# Altium project Smart-Switch-v1.0.PrjPcb (part 1 of 2)
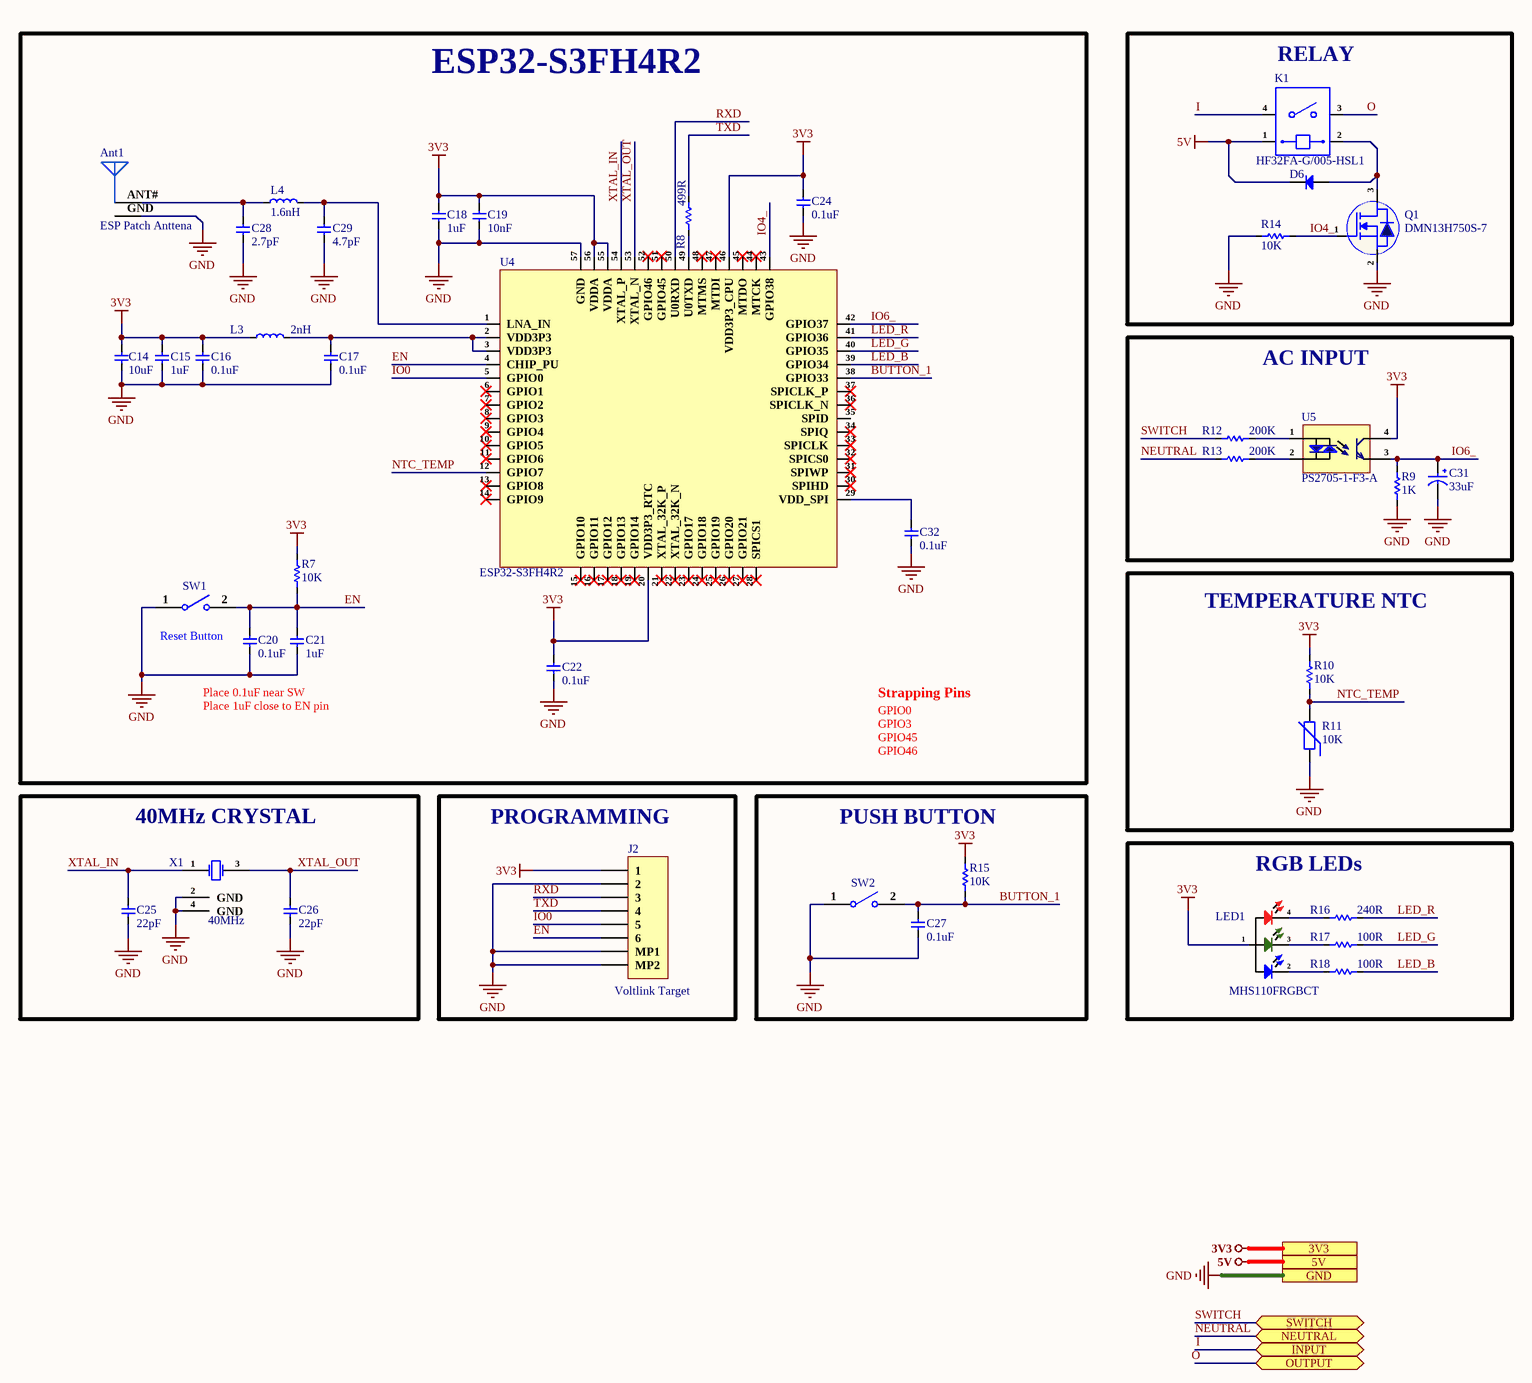
[diagram p0: Controller-Sheet.SchDoc]
3 sheets, 74 parts. Net scope: hierarchical (ports join the sheet entries above them; power ports are global).
Board file: Smart-Switch-v1.0.PcbDoc
Sheets:
  Controller-Sheet.SchDoc
  Top-Sheet.SchDoc
    U_Power-Sheet = Power-Sheet.SchDoc

## Sheet Controller-Sheet.SchDoc: Title
size 420 x 297 mm; Date: *******; ApprovedBy: *******; CheckedBy: None; Author: *******; CompanyName: *******; DrawnBy: Name; Engineer: *******; Organization: *******; Address1: *******; Address2: *******; Address3: *******; Address4: *******; DocumentNumber: Doc Num; Revision: *******; SheetNumber: 3; SheetTotal: 3; CurrentTime: *******; CurrentDate: *******; Time: *******; DocumentFullPathAndName: *******; DocumentName: *******; ModifiedDate: *******; ImagePath: *******; ProjectName: *******; Application_BuildNumber: *******

### Parts
Ant1  ESP Patch Anttena  [ESP Patch Antenna]  (net tie, no BOM)
C14  10uF  [Cap-0402]
C15  1uF  [CAP-0201]
C16  0.1uF  [CAP-0201]
C17  0.1uF  [CAP-0201]
C18  1uF  [CAP-0201]
C19  10nF  [CAP-0201]
C20  0.1uF  [CAP-0201]
C21  1uF  [CAP-0201]
C22  0.1uF  [CAP-0201]
C24  0.1uF  [CAP-0201]
C25  22pF  [CAP-0201]
C26  22pF  [CAP-0201]
C27  0.1uF  [CAP-0201]
C28  2.7pF  [CAP-0201]
C29  4.7pF  [CAP-0201]
C31  33uF  [Case-B]
C32  0.1uF  [CAP-0201]
D6  1N4148WT  [SOD-523F]  (value not drawn)
J2  Voltlink Target  [Voltlink Target]
K1  HF32FA-G/005-HSL1  [HF32FA-G/005-HSL1]
L3  2nH  [IND-0603 (1608 Metric)]
L4  1.6nH  [IND-0603 (1608 Metric)]
LED1  MHS110FRGBCT  [MHS110FRGBCT]
Q1  DMN13H750S-7  [SOT-23]
R7  10K  [Res-0201]
R8  499R  [Res-0201]
R9  1K  [Res-0402]
R10  10K  [Res-0201]
R11  10K  [Res-0603]
R12  200K  [Res_1210]
R13  200K  [Res_1210]
R14  10K  [Res-0201]
R15  10K  [Res-0201]
R16  240R  [Res-0603]
R17  100R  [RES-0603]
R18  100R  [RES-0603]
SW1  B3U-1000P  [B3U-1000P]  (value not drawn)
SW2  B3U-1000P  [B3U-1000P]  (value not drawn)
U4  ESP32-S3FH4R2  [QFNWB-56 (7×7)]
U5  PS2705-1-F3-A  [SOP-4_2.54]
X1  40MHz  [X322540MPB4SI_]

### Blocks framed on the sheet
ESP32-S3FH4R2: Ant1 C14-C22 C24 C28 C29 C32 L3 L4 R7 R8 SW1 U4
RELAY: D6 K1 Q1 R14
AC INPUT: C31 R9 R12 R13 U5
TEMPERATURE NTC: R10 R11
40MHz CRYSTAL: C25 C26 X1
PROGRAMMING: J2
PUSH BUTTON: C27 R15 SW2
RGB LEDs: LED1 R16-R18

### Ports
3V3 (see Top-Sheet[3B], Power-Sheet[3D]), 5V (see Top-Sheet[3C], Power-Sheet[3D]), GND (see Top-Sheet[3B], Power-Sheet[3D]), INPUT (bidir, see Top-Sheet[3B], Power-Sheet[2D]), NEUTRAL (bidir, see Top-Sheet[3C], Power-Sheet[2D]), OUTPUT (bidir, see Top-Sheet[3B], Power-Sheet[2D]), SWITCH (bidir, see Top-Sheet[3C], Power-Sheet[2D])

### Nets
3V3: C14.2 C15.2 C16.2 C18.2 C19.2 C22.2 C24.2 J2.1 L3.1 LED1.1(+) R7.2 R10.1 R15.2 U4.20(VDD3P3_RTC) U4.46(VDD3P3_CPU) U4.55(VDDA) U4.56(VDDA) U5.4(C) ; port 3V3
5V: D6.2(K) K1.1 ; port 5V
GND: Ant1.GND C14.1 C15.1 C16.1 C17.1 C18.1 C19.1 C20.1 C21.1 C22.1 C24.1 C25.1 C26.1 C27.1 C28.1 C29.1 C31.2 C32.1 J2.2 J2.MP1 J2.MP2 Q1.2(S) R9.1 R11.1 R14.2 SW1.1 SW2.1 U4.57(GND) X1.2(GND) X1.4(GND) ; port GND
BUTTON_1: C27.2 R15.1 SW2.2 U4.38(GPIO33)
EN: C20.2 C21.2 J2.6 R7.1 SW1.2 U4.4(CHIP_PU)
I: K1.4 ; port INPUT
IO0: J2.5 U4.5(GPIO0)
IO4_: Q1.1(G) R14.1 U4.43(GPIO38)
IO6_: C31.1 R9.2 U4.42(GPIO37) U5.3(E)
LED_B: R18.2 U4.39(GPIO34)
LED_G: R17.2 U4.40(GPIO35)
LED_R: R16.2 U4.41(GPIO36)
NEUTRAL: R13.1 ; port NEUTRAL
NTC_TEMP: R10.2 R11.2 U4.12(GPIO7)
O: K1.3 ; port OUTPUT
RXD: J2.3 U4.50(U0RXD)
SWITCH: R12.1 ; port SWITCH
TXD: J2.4 R8.2
XTAL_IN: C25.2 U4.54(XTAL_P) X1.1(CRYSTAL)
XTAL_OUT: C26.2 U4.53(XTAL_N) X1.3(CRYSTAL)
NetAnt1_ANT#: Ant1.ANT# C28.2 L4.1
NetC17_2: C17.2 L3.2 U4.2(VDD3P3) U4.3(VDD3P3)
NetC29_2: C29.2 L4.2 U4.1(LNA_IN)
NetC32_2: C32.2 U4.29(VDD_SPI)
NetD6_1: D6.1(A) K1.2 Q1.3(D)
NetLED1_2: LED1.2(-BLUE) R18.1
NetLED1_3: LED1.3(-GREEN) R17.1
NetLED1_4: LED1.4(-RED) R16.1
NetR8_1: R8.1 U4.49(U0TXD)
NetR12_2: R12.2 U5.1(An)
NetR13_2: R13.2 U5.2(Ca)

Not connected (* = marked no-connect by the designer): U4 6(GPIO1)* 7(GPIO2)* 8(GPIO3)* 9(GPIO4)* 10(GPIO5)* 11(GPIO6)* 13(GPIO8)* 14(GPIO9)* 15(GPIO10)* 16(GPIO11)* 17(GPIO12)* 18(GPIO13)* 19(GPIO14)* 21(XTAL_32K_P)* 22(XTAL_32K_N)* 23(GPIO17)* 24(GPIO18)* 25(GPIO19)* 26(GPIO20)* 27(GPIO21)* 28(SPICS1)* 30(SPIHD)* 31(SPIWP)* 32(SPICS0)* 33(SPICLK)* 34(SPIQ)* 35(SPID) 36(SPICLK_N)* 37(SPICLK_P)* 44(MTCK)* 45(MTDO)* 47(MTDI)* 48(MTMS)* 51(GPIO45)* 52(GPIO46)*

### Notes on the sheet
- Reset Button
- Place 1uF close to EN pin
- Place 0.1uF near SW
- Strapping Pins
- GPIO0
  GPIO3
  GPIO45
  GPIO46
- File:
- Title:
- Date:
- Page
- Num:
- Total:
- Drawn By: Huzaifa Ali

### Library data of the parts
Ant1 = ESP Patch Anttena: ESP32 MIFA PCB ANTENNA; Item Type: Antenna; Manufacturer Part Number: ESP Patch Anttena
C14 = CL05A106MP5NUNC: CAP CER 10UF 10V X5R 0402; Manufacturer: Samsung; Tolerance: 20%; Item Type: Capacitor; Supplier 1: Avnet; Manufacturer Part Number: CL05A106MP5NUNC; RoHS: Yes; Category: Ceramic Capacitors; Stock 1: 1729850; Pricing 1: 10000=0.02537 (USD); Mount: Surface Mount; Case/Package: 0402; Case Code (Metric): 1005; Case Code (Imperial): 0402; Contact Plating: Tin; Min Operating Temperature: -55°C; Max Operating Temperature: 85°C; Package Quantity: 1; Packaging: Tape and Reel; Capacitance: 10uF; Voltage Rating: 10V; Dielectric: X5R; Termination: Wraparound; Series: CL; Construction: Flat; Length: 1mm; Width: 0.02inch; Thickness: 0.028inch; Depth: 0.5mm; Radiation Hardening: No; Lead Free: Lead Free; RoHS Compliant: Yes; ComponentLink1URL: https://datasheet.ciiva.com/25721/cl05a106mp5nunc-25721584.pdf?src-supplier=Digi-Key; ComponentLink1Description: https://datasheet.ciiva.com/25721/cl05a106mp5nunc-25721584.pdf?src-supplier=Digi-Key; ComponentLink2URL: https://datasheet.ciiva.com/26838/getdatasheetpartid-745310-26838170.pdf?src-supplier=Verical; ComponentLink2Description: https://datasheet.ciiva.com/26838/getdatasheetpartid-745310-26838170.pdf?src-supplier=Verical; Supplier Part Number 1: CL05A106MP5NUNC; LCSC Part Number: C315248
C15 C18 C21 = GRM033R61C105ME15D: CAP CER 1UF 16V X5R 0201; Manufacturer: Murata; Item Type: Capacitor; Supplier 1: Digi-Key; Manufacturer Part Number: GRM033R61C105ME15D; Stock 1: 12823; Pricing 1: 1=0.14, 10=0.098, 50=0.0554, 100=0.0459, 500=0.0322, 1000=0.02665, 2500=0.02481, 5000=0.0227 (USD); ComponentLink1URL: https://datasheet.octopart.com/GRM033R61C105ME15D-Murata-datasheet-155345049.pdf?src-supplier=Element14; ComponentLink1Description: https://datasheet.octopart.com/GRM033R61C105ME15D-Murata-datasheet-155345049.pdf?src-supplier=Element14; Supplier Part Number 1: 490-18654-1-ND; LCSC Part Number: C335102; RoHS: No; Category: Ceramic Capacitors; ComponentLink2URL: https://datasheet.octopart.com/GRM033R61C105ME15D-Murata-datasheet-165579666.pdf?src-supplier=TME; ComponentLink2Description: https://datasheet.octopart.com/GRM033R61C105ME15D-Murata-datasheet-165579666.pdf?src-supplier=TME
C16 C17 C20 C22 C24 C27 C32 = GRM033R61E104KE14D: CAP CER 0.1UF 25V X5R 0201; Manufacturer: Murata; Tolerance: 10%; Item Type: Capacitor; Material: 4241ConductorMaterial; Value: 100nF; Manufacturer Part Number: GRM033R61E104KE14D; RoHS: Yes; Category: Ceramic Capacitors; Case/Package: 0201; Case Code (Metric): 0603; Case Code (Imperial): 0201; Weight: 1.2E-05oz; Min Operating Temperature: -55°C; Max Operating Temperature: 85°C; Packaging: Tape and Reel; Voltage Rating: 25V; Dielectric: X5R; Termination: SMD/SMT; Voltage Rating (DC): 25V; Package Quantity: 15000; Series: GRM; Length: 0.024inch; Width: 0.012inch; Height: 0.3mm; Thickness: 0.013inch; Lead Free: Lead Free; RoHS Compliant: Yes; ComponentLink1URL: http://www.farnell.com/datasheets/2867843.pdf?src-supplier=Farnell; ComponentLink1Description: http://www.farnell.com/datasheets/2867843.pdf?src-supplier=Farnell; ComponentLink2URL: http://www.mouser.com/ds/2/281/c02e-2905.pdf?src-supplier=Mouser; ComponentLink2Description: http://www.mouser.com/ds/2/281/c02e-2905.pdf?src-supplier=Mouser; ComponentLink3URL: https://datasheet.octopart.com/GRM033R61E104KE14D-Murata-datasheet-22122223.pdf?src-supplier=Future+Electronics; ComponentLink3Description: https://datasheet.octopart.com/GRM033R61E104KE14D-Murata-datasheet-22122223.pdf?src-supplier=Future+Electronics; ComponentLink4URL: http://www.farnell.com/datasheets/2867843.pdf?src-supplier=Element14; ComponentLink4Description: http://www.farnell.com/datasheets/2867843.pdf?src-supplier=Element14; ComponentLink5URL: http://search.murata.co.jp/Ceramy/image/img/A01X/G101/ENG/GRM033R61E104KE14-01.pdf?src-supplier=Digi-Key; ComponentLink5Description: http://search.murata.co.jp/Ceramy/image/img/A01X/G101/ENG/GRM033R61E104KE14-01.pdf?src-supplier=Digi-Key; LCSC Part Number: C76939; Supplier: Rs; Supplier Part Number: 1852066; Stock: 14000; Pricing: 1000=0.008, 5000=0.007, 10000=0.006 (GBP); Mounting Technology: Surface Mount; ComponentLink6URL: http://www.farnell.com/datasheets/2867843.pdf?src-supplier=Newark; ComponentLink6Description: http://www.farnell.com/datasheets/2867843.pdf?src-supplier=Newark; ComponentLink7URL: https://datasheet.octopart.com/GRM033R61E104KE14D-Murata-datasheet-165579666.pdf?src-supplier=TME; ComponentLink7Description: https://datasheet.octopart.com/GRM033R61E104KE14D-Murata-datasheet-165579666.pdf?src-supplier=TME
C19 = GRM033R71E103KE14D: CAP CER 10000PF 25V X7R 0201; Manufacturer: Murata; Tolerance: 10%; Item Type: Capacitor; Material: 4241ConductorMaterial; Supplier 1: Avnet; Manufacturer Part Number: GRM033R71E103KE14D; RoHS: Yes; Category: Ceramic Capacitors; Stock 1: 60000; Pricing 1: 15000=0.00231 (USD); Mount: Surface Mount; Case/Package: 0201; Min Operating Temperature: -55°C; Max Operating Temperature: 125°C; Capacitance: 10nF; Dielectric: X7R; Voltage Rating: 25V; Voltage Rating (DC): 25V; Series: GRM; Length: 600um; Width: 300um; Height: 330um; Thickness: 300um; RoHS Compliant: Yes; ComponentLink1URL: http://www.farnell.com/datasheets/2867850.pdf?src-supplier=Farnell; ComponentLink1Description: http://www.farnell.com/datasheets/2867850.pdf?src-supplier=Farnell; ComponentLink2URL: http://www.farnell.com/datasheets/2867850.pdf?src-supplier=Element14; ComponentLink2Description: http://www.farnell.com/datasheets/2867850.pdf?src-supplier=Element14; ComponentLink3URL: http://search.murata.co.jp/Ceramy/image/img/A01X/G101/ENG/GRM033R71E103KE14-01.pdf?src-supplier=Digi-Key; ComponentLink3Description: http://search.murata.co.jp/Ceramy/image/img/A01X/G101/ENG/GRM033R71E103KE14-01.pdf?src-supplier=Digi-Key; ComponentLink4URL: https://datasheet.octopart.com/GRM033R71E103KE14D-Murata-datasheet-99353822.pdf?src-supplier=Future+Electronics; ComponentLink4Description: https://datasheet.octopart.com/GRM033R71E103KE14D-Murata-datasheet-99353822.pdf?src-supplier=Future+Electronics; ComponentLink5URL: http://www.farnell.com/datasheets/2867850.pdf?src-supplier=Newark; ComponentLink5Description: http://www.farnell.com/datasheets/2867850.pdf?src-supplier=Newark; ComponentLink6URL: https://datasheet.octopart.com/GRM033R71E103KE14D-Murata-datasheet-165579666.pdf?src-supplier=TME; ComponentLink6Description: https://datasheet.octopart.com/GRM033R71E103KE14D-Murata-datasheet-165579666.pdf?src-supplier=TME; Supplier Part Number 1: GRM033R71E103KE14D; LCSC Part Number: C85930
C25 C26 = GRM0335C1H220JA01D: CAP CER 22PF 50V C0G/NP0 0201; Manufacturer: Murata; Tolerance: 5%; Dielectric: C0G; Temperature Coefficient: 30ppm/°C; Item Type: Capacitor; Material: 4241ConductorMaterial; Manufacturer Part Number: GRM0335C1H220JA01D; RoHS: Yes; Category: Ceramic Capacitors; Mounting Technology: Surface Mount; Case/Package: 0201; Case Code (Metric): 0603; Case Code (Imperial): 0201; Min Operating Temperature: -55°C; Max Operating Temperature: 125°C; Value: 22pF; Voltage Rating: 50V; Packaging: Tape and Reel; Package Quantity: 1; Voltage Rating (DC): 50V; Termination: SMD/SMT; Voltage: 50V; Series: GRM; Length: 0.024inch; Width: 0.012inch; Height: 0.3mm; Depth: 0.3mm; Lead Free: Lead Free; RoHS Compliant: Yes; ComponentLink1URL: https://datasheet.ciiva.com/6271/partnumbering-e-01-6271146.pdf?src-supplier=Digi-Key; ComponentLink1Description: https://datasheet.ciiva.com/6271/partnumbering-e-01-6271146.pdf?src-supplier=Digi-Key; ComponentLink2URL: https://datasheet.ciiva.com/6271/partnumbering-e-01-6271143.pdf?src-supplier=Digi-Key; ComponentLink2Description: https://datasheet.ciiva.com/6271/partnumbering-e-01-6271143.pdf?src-supplier=Digi-Key; ComponentLink3URL: https://datasheet.ciiva.com/6271/partnumbering-e-01-6271149.pdf?src-supplier=Digi-Key; ComponentLink3Description: https://datasheet.ciiva.com/6271/partnumbering-e-01-6271149.pdf?src-supplier=Digi-Key; LCSC Part Number: C76924; Supplier: Rs; Supplier Part Number: 8202728; Stock: 9500; Pricing: 500=0.004, 5000=0.003, 12500=0.002, 50000=0.002 (GBP)
C28 = CC0201CRNPO9BN2R7: CAP CER 2.7PF 50V C0G/NPO 0201; Manufacturer: Yageo; Dielectric: C0G; Item Type: Capacitor; Supplier: Avnet; Supplier Part Number: CC0201CRNPO9BN2R7; Manufacturer Part Number: CC0201CRNPO9BN2R7; RoHS: Yes; Category: Ceramic Capacitors; Stock: 15000; Pricing: 15000=0.0017 (USD); Mounting Technology: Surface Mount; Case/Package: 0201; Case Code (Imperial): 0201; Case Code (Metric): 0603; Weight: 6E-06oz; Min Operating Temperature: -55°C; Max Operating Temperature: 125°C; Value: 2.7pF; Packaging: Tape and Reel; Voltage Rating (DC): 50V; Voltage Rating: 50V; Termination: SMD/SMT; Series: CC; Length: 0.024inch; Width: 0.012inch; Thickness: 0.013inch; RoHS Compliant: Yes; ComponentLink1URL: https://datasheet.ciiva.com/13208/upy-gp-np0-16v-to-50v-8-13208314.pdf?src-supplier=Mouser; ComponentLink1Description: https://datasheet.ciiva.com/13208/upy-gp-np0-16v-to-50v-8-13208314.pdf?src-supplier=Mouser; LCSC Part Number: C325439
C29 = CC0201BRNPO9BN4R7: CAP CER 4.7PF 50V C0G/NPO 0201; Manufacturer: Yageo; Item Type: Capacitor; Supplier: Arrow Electronics; Supplier Part Number: CC0201BRNPO9BN4R7; Manufacturer Part Number: CC0201BRNPO9BN4R7; RoHS: Yes; Category: Ceramic Capacitors; Stock: 210000; Pricing: 15000=0.0023 (USD); Mounting Technology: Surface Mount; Case/Package: 0201; Min Operating Temperature: -55°C; Max Operating Temperature: 125°C; Packaging: Tape and Reel; Value: 4.7pF; Voltage Rating: 50V; Series: CC; Length: 0.024inch; Width: 0.012inch; Thickness: 0.013inch; RoHS Compliant: Yes; ComponentLink1URL: https://www.yageo.com/upload/media/product/productsearch/datasheet/mlcc/UPY-GP_NP0_16V-to-50V_18.pdf?src-supplier=Digi-Key; ComponentLink1Description: https://www.yageo.com/upload/media/product/productsearch/datasheet/mlcc/UPY-GP_NP0_16V-to-50V_18.pdf?src-supplier=Digi-Key; ComponentLink2URL: http://www.yageo.com/documents/recent/UPY-GP_NP0_16V-to-50V_16.pdf?src-supplier=Digi-Key; ComponentLink2Description: http://www.yageo.com/documents/recent/UPY-GP_NP0_16V-to-50V_16.pdf?src-supplier=Digi-Key; LCSC Part Number: C505471
C31 = TAJB336K010RNJ: CAP TANT 33UF 10% 10V 1411; Manufacturer: Kyocera AVX; Dielectric Material: Tantalum; ESR (Equivalent Series Resistance): 1.8R; Leakage Current: 3.3uA; Polarity: Polar; Dissipation Factor: 6%; Item Type: Capacitor; Supplier 1: Rs; Manufacturer Part Number: TAJB336K010RNJ; RoHS: Yes; Category: Tantalum Capacitors; Stock 1: 1580; Pricing 1: 100=0.01410, 400=0.24800, 1000=0.21600 (GBP); Mounting Technology: Surface Mount,PCB; Case/Package: 1210; Pins: 2; Case Code (Metric): 3528; Case Code (Imperial): 1210; Min Operating Temperature: -55°C; Max Operating Temperature: 125°C; Tolerance: 10%; Value: 33uF; Packaging: Tape and Reel; Voltage Rating: 10V; Voltage Rating (DC): 10V; Package Quantity: 1; Termination: SMD/SMT; Voltage: 10V; Features: General Purpose; Series: TAJ; Construction: Flat; Length: 3.5mm; Width: 2.8mm; Height: 1.9mm; Height - Seated (Max): 0.083inch; Depth: 2.8mm; Lead Pitch: 1.4mm; Radiation Hardening: No; Reach SVHC Compliant: Yes; Lead Free: Lead Free; RoHS Compliant: Yes; ComponentLink1URL: https://datasheet.ciiva.com/26341/559435-da-01-en-tacc-b-3-2-mm-x-2-5-mm-x-1-9-mm-33-uf-26341776.pdf?src-supplier=Conrad; ComponentLink1Description: https://datasheet.ciiva.com/26341/559435-da-01-en-tacc-b-3-2-mm-x-2-5-mm-x-1-9-mm-33-uf-26341776.pdf?src-supplier=Conrad; ComponentLink2URL: https://datasheet.ciiva.com/7775/49917-7775706.pdf?src-supplier=Element14; ComponentLink2Description: https://datasheet.ciiva.com/7775/49917-7775706.pdf?src-supplier=Element14; ComponentLink3URL: https://datasheet.ciiva.com/7775/49917-7775705.pdf?src-supplier=Element14; ComponentLink3Description: https://datasheet.ciiva.com/7775/49917-7775705.pdf?src-supplier=Element14; ComponentLink4URL: https://datasheet.ciiva.com/7775/1680476-7775704.pdf?src-supplier=Element14; ComponentLink4Description: https://datasheet.ciiva.com/7775/1680476-7775704.pdf?src-supplier=Element14; ComponentLink5URL: https://datasheet.ciiva.com/264/taj-264134.pdf?src-supplier=Digi-Key; ComponentLink5Description: https://datasheet.ciiva.com/264/taj-264134.pdf?src-supplier=Digi-Key; ComponentLink6URL: https://datasheet.ciiva.com/264/taj-264133.pdf?src-supplier=Digi-Key; ComponentLink6Description: https://datasheet.ciiva.com/264/taj-264133.pdf?src-supplier=Digi-Key; ComponentLink7URL: https://datasheet.ciiva.com/264/taj-264135.pdf?src-supplier=Digi-Key; ComponentLink7Description: https://datasheet.ciiva.com/264/taj-264135.pdf?src-supplier=Digi-Key; ComponentLink8URL: https://datasheet.ciiva.com/12884/taj-27497-12884279.pdf?src-supplier=Mouser; ComponentLink8Description: https://datasheet.ciiva.com/12884/taj-27497-12884279.pdf?src-supplier=Mouser; ComponentLink9URL: https://datasheet.ciiva.com/14590/70001050-14590215.pdf?src-supplier=Allied+Electronics; ComponentLink9Description: https://datasheet.ciiva.com/14590/70001050-14590215.pdf?src-supplier=Allied+Electronics; ComponentLink10URL: https://datasheet.ciiva.com/14592/70001050-14592670.pdf?src-supplier=Allied+Electronics; ComponentLink10Description: https://datasheet.ciiva.com/14592/70001050-14592670.pdf?src-supplier=Allied+Electronics; ComponentLink11URL: https://datasheet.ciiva.com/11224/taj-11224937.pdf?src-supplier=Avnet; ComponentLink11Description: https://datasheet.ciiva.com/11224/taj-11224937.pdf?src-supplier=Avnet; ComponentLink12URL: https://datasheet.ciiva.com/16492/taj-16492863.pdf?src-supplier=Future+Electronics; ComponentLink12Description: https://datasheet.ciiva.com/16492/taj-16492863.pdf?src-supplier=Future+Electronics; ComponentLink13URL: https://datasheet.ciiva.com/11224/taj-11224941.pdf?src-supplier=Avnet; ComponentLink13Description: https://datasheet.ciiva.com/11224/taj-11224941.pdf?src-supplier=Avnet; Supplier Part Number 1: 1364604P; LCSC Part Number: C7202
D6 = 1N4148WT: DIODE GEN PURP 75V 200MA SOD523F; Manufacturer: ON Semiconductor / Fairchild; Recovery Time: 4ns; Forward Current: 300mA; Max Reverse Current: 5uA; Power Dissipation: 200mW; Max Forward Surge Current (Ifsm): 4A; Element Configuration: Single; Supplier 1: Future Electronics; Manufacturer Part Number: 1N4148WT; RoHS: Yes; Category: Rectifier Diodes; Stock 1: 30; Pricing 1: 1=0.0305, 20=0.0267, 125=0.0246, 750=0.0227, 4000=0.0204 (USD); Mounting Technology: Surface Mount; Pins: 2; Weight: 0.01g; Contact Plating: Tin,Matte; Min Operating Temperature: -55°C; Max Operating Temperature: 150°C; Packaging: Tape and Reel; Package Quantity: 1; Series: -; Reverse Recovery Time: 4ns; Max Repetitive Reverse Voltage (Vrrm): 75V; Average Rectified Current: 200mA; Max Reverse Voltage (DC): 75V; Reverse Recovery Time-Max: 4ns; Length: 1.3mm; Width: 0.9mm; Height: 0.7mm; Radiation Hardening: No; RoHS Compliant: Yes; Lead Free: Lead Free; Reach SVHC Compliant: No; ComponentLink1URL: https://datasheet.ciiva.com/16744/1n4148wt-16744972.pdf?src-supplier=Future+Electronics; ComponentLink1Description: https://datasheet.ciiva.com/16744/1n4148wt-16744972.pdf?src-supplier=Future+Electronics; ComponentLink2URL: https://datasheet.ciiva.com/30479/0900766b810e1cd4-30479226.pdf?src-supplier=Rs; ComponentLink2Description: https://datasheet.ciiva.com/30479/0900766b810e1cd4-30479226.pdf?src-supplier=Rs; ComponentLink3URL: https://datasheet.ciiva.com/15208/getdatasheetpartid-146392-15208359.pdf?src-supplier=Verical; ComponentLink3Description: https://datasheet.ciiva.com/15208/getdatasheetpartid-146392-15208359.pdf?src-supplier=Verical; ComponentLink4URL: https://datasheet.ciiva.com/916/1n914bwt-916865.pdf?src-supplier=Digi-Key; ComponentLink4Description: https://datasheet.ciiva.com/916/1n914bwt-916865.pdf?src-supplier=Digi-Key; ComponentLink5URL: https://datasheet.ciiva.com/916/1n914bwt-916866.pdf?src-supplier=Digi-Key; ComponentLink5Description: https://datasheet.ciiva.com/916/1n914bwt-916866.pdf?src-supplier=Digi-Key; ComponentLink6URL: https://datasheet.ciiva.com/916/1n914bwt-916864.pdf?src-supplier=Digi-Key; ComponentLink6Description: https://datasheet.ciiva.com/916/1n914bwt-916864.pdf?src-supplier=Digi-Key; Supplier Part Number 1: 6145918; LCSC Part Number: C232841; Item Type: Diode
J2 = C145963: 1x6P SH 1 1mm 6 SMD,P=1mm Wire To Board / Wire To Wire Connector ROHS; Manufacturer: BOOMELE; Manufacturer Part Number: C145963; Package: SMD,P=1mm; LCSC Part Number: C145963; Item Type: Connector; ComponentLink1Description: LCSC; ComponentLink1URL: https://www.lcsc.com/product-detail/Wire-To-Board-Wire-To-Wire-Connector_BOOMELE-Boom-Precision-Elec-C145963_C145963.html
K1 = HF32FA-G/005-HSL1: AgSnO2 5V 10A 10A@250VAC Normal Open:1A(SPST-Normal Open) 4 Plugin,10.1x17.6mm Power Relays ROHS; Manufacturer: HF; Item Type: Relay; Manufacturer Part Number: HF32FA-G/005-HSL1; Package: Plugin,10.1x17.6mm; LCSC Part Number: C91370; ComponentLink1Description: LCSC; ComponentLink1URL: https://www.lcsc.com/product-detail/Power-Relays_HF-Xiamen-Hongfa-Electroacoustic-HF32FA-G-005-HSL1_C91370.html
L3 = SDCL1608C2N0STDF: 2nH ±0.3nH 0603 Inductors; Manufacturer: Sunlord; Manufacturer Part Number: SDCL1608C2N0STDF; Footprint: 0603; ComponentLink1Description: LCSC; ComponentLink1URL: https://lcsc.com/product-detail/Inductors-SMD_Sunlord-SDCL1608C2N0STDF_C370234.html; Value: 2nH; LCSC Part Number: C370234
L4 = FHW0603UC1N6KST: 700mA 1.6nH ±10% 40mΩ 0603 Inductors (SMD) ROHS; Manufacturer: FH; Footprint: 0603; Manufacturer Part Number: FHW0603UC1N6KST; Value: 1.6nH; LCSC Part Number: C317978; ComponentLink1Description: LCSC; ComponentLink1URL: https://www.lcsc.com/product-detail/Inductors-SMD_FH-Guangdong-Fenghua-Advanced-Tech-FHW0603UC1N6KST_C317978.html
LED1 = MHS110FRGBCT: Colorless transparence Side stickers -40℃~+85℃ Common anode RGB 120° 60mW SMD,1.5x3.2mm Light Emitting Diodes (LED) ROHS; Manufacturer: MEIHUA; Item Type: RGB LED; Manufacturer Part Number: MHS110FRGBCT; Package: SMD,1.5x3.2mm; LCSC Part Number: C496820; ComponentLink1Description: LCSC; ComponentLink1URL: https://www.lcsc.com/product-detail/Light-Emitting-Diodes-LED_MEIHUA-MHS110FRGBCT_C496820.html
Q1 = DMN13H750S-7: MOSFET N-CH 130V 1A SOT23; Manufacturer: Diodes Incorporated; Manufacturer Part Number: DMN13H750S-7; Package: SOT-23-3L; LCSC Part Number: C156273; Item Type: Mosfet; ComponentLink1URL: https://www.lcsc.com/product-detail/MOSFETs_Diodes-Incorporated-DMN13H750S-7_C156273.html; ComponentLink1Description: LCSC
R7 R10 R14 R15 = RC0201FR-0710KL: RES SMD 10K OHM 1% 1/20W 0201; Manufacturer: Yageo; Item Type: Resistor; Manufacturer Part Number: RC0201FR-0710KL; Package: 0201; ComponentLink7Description: LCSC; ComponentLink7URL: https://www.lcsc.com/product-detail/Chip-Resistor-Surface-Mount_YAGEO-RC0201FR-0710KL_C106225.html; LCSC Part Number: C106225
R8 = RC0201FR-07499RL: RES 499 OHM 1% 1/20W 0201; Manufacturer: Yageo; Max Power Dissipation: 50mW; Temperature Coefficient: 200ppm/°C; Item Type: Resistor; Supplier 1: Avnet; Manufacturer Part Number: RC0201FR-07499RL; RoHS: Yes; Category: Chip SMD Resistors; Stock 1: 150000; Pricing 1: 10000=0.00128 (USD); Case/Package: 0201; Case Code (Metric): 0603; Case Code (Imperial): 0201; Min Operating Temperature: -55°C; Max Operating Temperature: 125°C; Resistance: 499R; Tolerance: 1%; Packaging: Tape and Reel; Resistor Type: Thick Film; Number of Terminations: 2; Features: Moisture Resistant; Length: 0.024inch; Width: 0.012inch; Height: 0.01inch; Depth: 0.3mm; RoHS Compliant: Yes; Military Standard: Not; Lead Free: Lead Free; ComponentLink1URL: http://www.yageo.com/documents/recent/PYu-RC_Group_51_RoHS_L_10.pdf?src-supplier=Digi-Key; ComponentLink1Description: http://www.yageo.com/documents/recent/PYu-RC_Group_51_RoHS_L_10.pdf?src-supplier=Digi-Key; ComponentLink2URL: http://www.yageo.com/documents/recent/PYu-RC_Group_51_RoHS_L_9.pdf?src-supplier=Digi-Key; ComponentLink2Description: http://www.yageo.com/documents/recent/PYu-RC_Group_51_RoHS_L_9.pdf?src-supplier=Digi-Key; Supplier Part Number 1: RC0201FR-07499RL; LCSC Part Number: C138137
R9 = RC0402FR-071KL: RES 1K OHM 1% 1/16W 0402; Manufacturer: Yageo; Resistance: 1kR; Temperature Coefficient: 100ppm/°C; Voltage Rating (DC): 50V; Power Rating: 62.5mW; Max Power Dissipation: 63mW; Item Type: Resistor; Supplier 1: Avnet; Manufacturer Part Number: RC0402FR-071KL; RoHS: Yes; Category: Chip SMD Resistors; Stock 1: 13030000; Pricing 1: 10000=0.00085, 20000=0.00087, 40000=0.00084, 60000=0.00083, 80000=0.00079, 100000=0.00078, 1000000=0.00076 (USD); Case/Package: 0402; Number of Pins: 2; Case Code (Imperial): 0402; Case Code (Metric): 1005; Size Code: 0402; Min Operating Temperature: -55°C; Max Operating Temperature: 155°C; Resistor Type: Thick Film; Tolerance: 1%; Packaging: Tape and Reel; Voltage Rating: 50V; Termination: SMD/SMT; Features: Moisture Resistant; Series: RC; Number of Terminations: 2; Resistance Tolerance: 1%; Construction: Rectangular; Technology: THICK FILM; Length: 1mm; Width: 0.5mm; Height: 0.32mm; Depth: 0.5mm; Reach SVHC Compliant: Yes; Lead Free: Lead Free; RoHS Compliant: Yes; Military Standard: Not; ComponentLink1URL: https://datasheet.ciiva.com/11819/0900766b80c66297-11819477.pdf?src-supplier=RSComponents; ComponentLink1Description: https://datasheet.ciiva.com/11819/0900766b80c66297-11819477.pdf?src-supplier=RSComponents; ComponentLink2URL: https://datasheet.ciiva.com/7983/1018594-7983502.pdf?src-supplier=Element14; ComponentLink2Description: https://datasheet.ciiva.com/7983/1018594-7983502.pdf?src-supplier=Element14; ComponentLink3URL: https://datasheet.ciiva.com/22747/1018594-22747513.pdf?src-supplier=Element14; ComponentLink3Description: https://datasheet.ciiva.com/22747/1018594-22747513.pdf?src-supplier=Element14; ComponentLink4URL: https://datasheet.ciiva.com/12666/pyu-rc0402-51-rohs-l-6-r-12666741.pdf?src-supplier=Mouser; ComponentLink4Description: https://datasheet.ciiva.com/12666/pyu-rc0402-51-rohs-l-6-r-12666741.pdf?src-supplier=Mouser; ComponentLink5URL: https://datasheet.ciiva.com/7849/1018594-7849869.pdf?src-supplier=Element14; ComponentLink5Description: https://datasheet.ciiva.com/7849/1018594-7849869.pdf?src-supplier=Element14; ComponentLink6URL: https://datasheet.ciiva.com/7849/1018594-7849871.pdf?src-supplier=Element14; ComponentLink6Description: https://datasheet.ciiva.com/7849/1018594-7849871.pdf?src-supplier=Element14; ComponentLink7URL: https://datasheet.ciiva.com/17063/pyu-rc0402-51-rohs-l-6-r-17063193.pdf?src-supplier=Future+Electronics; ComponentLink7Description: https://datasheet.ciiva.com/17063/pyu-rc0402-51-rohs-l-6-r-17063193.pdf?src-supplier=Future+Electronics; Supplier Part Number 1: RC0402FR-071KL; LCSC Part Number: C106235
R11 = B57332V5103F360: THERMISTOR NTC 10KOHM 3380K 0603; Manufacturer: TDK EPCOS; Item Type: NTC Thermistor; Value: 10kR; Power Rating: 180mW; Tolerance: 1%; Manufacturer Part Number: B57332V5103F360; LCSC Part Number: C209893; Supplier: Rs; Supplier Part Number: 8807288P; RoHS: Yes; Category: Thermistors; Stock: 178550; Pricing: 250=0.085 (GBP); Mounting Technology: Surface Mount; Case/Package: 0603; Pins: 2; Case Code (Metric): 1608; Case Code (Imperial): 0603; Contact Plating: Tin; Min Operating Temperature: -40°C; Max Operating Temperature: 150°C; Packaging: Tape and Reel; Package Quantity: 4000; Max Power Dissipation: 180mW; Termination: SMD/SMT; Series: B573; Resistance Tolerance: 1%; Length: 1.6mm; Width: 0.8mm; Height: 0.9mm; Depth: 0.8mm; Radiation Hardening: No; Reach SVHC Compliant: No; RoHS Compliant: Yes; ComponentLink1URL: https://datasheet.ciiva.com/26930/getdatasheetpartid-777571-26930642.pdf?src-supplier=Verical; ComponentLink1Description: https://datasheet.ciiva.com/26930/getdatasheetpartid-777571-26930642.pdf?src-supplier=Verical; ComponentLink2URL: https://datasheet.ciiva.com/46435/1835850-46435735.pdf?src-supplier=Element14; ComponentLink2Description: https://datasheet.ciiva.com/46435/1835850-46435735.pdf?src-supplier=Element14
R12 R13 = CR1210J30204G: 750mW Thick Film Resistors ±5% ±200ppm/℃ 200kΩ 1210 Chip Resistor - Surface Mount ROHS; Manufacturer: LIZ Elec; Manufacturer Part Number: CR1210J30204G; Package: 1210; LCSC Part Number: C102430; Item Type: Resistor; ComponentLink1Description: LCSC; ComponentLink1URL: https://www.lcsc.com/product-detail/Chip-Resistor-Surface-Mount_LIZ-Elec-CR1210J30204G_C102430.html
R16 = RT0603BRD07240RL: RES SMD 240 OHM 0.1% 1/10W 0603; Manufacturer: Yageo; Power Rating: 100mW; Temperature Coefficient: 25ppm/°C; Voltage Rating (DC): 50V; Voltage Rating: 75V; Supplier 1: Arrow Electronics; Manufacturer Part Number: RT0603BRD07240RL; RoHS: Yes; Category: Chip SMD Resistors; Stock 1: 5; Pricing 1: 1=0.13940 (USD); Case/Package: 0603; Case Code (Metric): 1608; Case Code (Imperial): 0603; Min Operating Temperature: -55°C; Max Operating Temperature: 125°C; Resistance: 240R; Tolerance: 0.1%; Packaging: Tape and Reel; Resistor Type: Thin Film; Number of Terminations: 2; Termination: SMD/SMT; Max Power Dissipation: 100mW; Features: Moisture Resistant; Series: RT; Construction: Rectangular; Length: 1.6mm; Width: 0.031inch; Height: 0.022inch; Depth: 0.8mm; Lead Free: Lead Free; RoHS Compliant: Yes; Military Standard: Not; ComponentLink1URL: https://datasheet.ciiva.com/8886/pyu-rt-1-to-0-05-rohs-l-4-8886602.pdf?src-supplier=Avnet; ComponentLink1Description: https://datasheet.ciiva.com/8886/pyu-rt-1-to-0-05-rohs-l-4-8886602.pdf?src-supplier=Avnet; ComponentLink2URL: https://datasheet.ciiva.com/12799/pyu-rt-1-to-0-05-rohs-l-4-12799039.pdf?src-supplier=Mouser; ComponentLink2Description: https://datasheet.ciiva.com/12799/pyu-rt-1-to-0-05-rohs-l-4-12799039.pdf?src-supplier=Mouser; Supplier Part Number 1: RT0603BRD07240RL; Contact Plating: Tin,Matte; Radiation Hardening: No; LCSC Part Number: C705750
R17 R18 = RCA0603100RFKEAHP: RES SMD 100 OHM 1% 1/4W 0603; Manufacturer: Vishay Dale; Temperature Coefficient: 100ppm/°C; Max Power Dissipation: 250mW; Supplier 1: Digi-Key; Manufacturer Part Number: RCA0603100RFKEAHP; Stock 1: 0; Case/Package: 0603; Case Code (Imperial): 0603; Case Code (Metric): 1608; Min Operating Temperature: -55°C; Max Operating Temperature: 155°C; Tolerance: 1%; Resistance: 100R; Packaging: Tape and Reel; Resistor Type: Thick Film; Features: Automotive AEC-Q200,Anti-Sulfur; Number of Terminations: 2; RoHS Compliant: Yes; ComponentLink1URL: http://www.vishay.com/docs/20067/rcahp.pdf?src-supplier=Digi-Key; ComponentLink1Description: http://www.vishay.com/docs/20067/rcahp.pdf?src-supplier=Digi-Key; Supplier Part Number 1: 541-3244-2-ND; LCSC Part Number: C2074203
SW1 SW2 = B3U-1000P: SWITCH TACTILE SPST-NO 0.05A 12V; Manufacturer: Omron; Mechanical Life: 200000Cycles; Operating Force: 1.5N; Throw Configuration: SPST; Current Rating: 50mA; Contact Resistance: 100mR; Illumination Type: Non-Illuminated,Illuminated; Switch Travel: 0.15mm; Switch Function: Off-Mom; Actuator Type: Standard; Actuator Length: 0.4mm; Ratings: Dust Proof,IP40; ComponentLink1URL: http://www.farnell.com/datasheets/60838.pdf?src-supplier=Farnell; ComponentLink1Description: http://www.farnell.com/datasheets/60838.pdf?src-supplier=Farnell; ComponentLink2URL: http://www.farnell.com/datasheets/60838.pdf?src-supplier=Element14; ComponentLink2Description: http://www.farnell.com/datasheets/60838.pdf?src-supplier=Element14; ComponentLink3URL: https://omronfs.omron.com/en_US/ecb/products/pdf/en-b3u.pdf?src-supplier=Digi-Key; ComponentLink3Description: https://omronfs.omron.com/en_US/ecb/products/pdf/en-b3u.pdf?src-supplier=Digi-Key; ComponentLink4URL: http://www.omron.com/ecb/products/pdf/en-b3u.pdf?src-supplier=Digi-Key; ComponentLink4Description: http://www.omron.com/ecb/products/pdf/en-b3u.pdf?src-supplier=Digi-Key; ComponentLink5URL: https://www.distrelec.biz/Web/Downloads/he/et/B3U_eng_datasheet.pdf?mime=application%2Fpdf&src-supplier=Distrelec; ComponentLink5Description: https://www.distrelec.biz/Web/Downloads/he/et/B3U_eng_datasheet.pdf?mime=application%2Fpdf&src-supplier=Distrelec; ComponentLink6URL: http://www.onlinecomponents.com/productFiles/mf-OM/en-b3u.pdf?src-supplier=Onlinecomponents.com; ComponentLink6Description: http://www.onlinecomponents.com/productFiles/mf-OM/en-b3u.pdf?src-supplier=Onlinecomponents.com; Supplier 1: Digi-Key; Manufacturer Part Number: B3U-1000P; Stock 1: 116454; Pricing 1: 1=1, 10=0.961, 25=0.9064, 50=0.7976, 100=0.7251, 250=0.68888, 500=0.67074, 1000=0.52571 (USD); Mount: Surface Mount; Weight: 0.000776oz; Contact Material: Silver; Min Operating Temperature: -25°C; Max Operating Temperature: 70°C; Packaging: Tape and Reel; Voltage Rating (DC): 12V; Package Quantity: 1; Max Current Rating: 50mA; Termination: SMD/SMT; Orientation: Straight; Max Voltage Rating (DC): 12V; Electrical Life: 200000Cycles; Insulation Resistance: 100MR; Contact Current Rating: 50mA; Length: 4mm; Height: 1.2mm; Depth: 2.5mm; Width: 3mm; REACH SVHC: Unknown; Lead Free: Lead Free; ComponentLink7URL: https://www.verical.com/server-webapp/html/getDatasheet?partID=552554&src-supplier=Verical; ComponentLink7Description: https://www.verical.com/server-webapp/html/getDatasheet?partID=552554&src-supplier=Verical; ComponentLink8URL: http://www.farnell.com/datasheets/1685550.pdf?src-supplier=Element14; ComponentLink8Description: http://www.farnell.com/datasheets/1685550.pdf?src-supplier=Element14; ComponentLink9URL: http://www.farnell.com/datasheets/2610940.pdf?src-supplier=Farnell; ComponentLink9Description: http://www.farnell.com/datasheets/2610940.pdf?src-supplier=Farnell; ComponentLink10URL: https://www.alliedelec.com/m/d/4c8a9ef82804fc3c241a13c1e298fd73.pdf?src-supplier=Allied+Electronics; ComponentLink10Description: https://www.alliedelec.com/m/d/4c8a9ef82804fc3c241a13c1e298fd73.pdf?src-supplier=Allied+Electronics; Supplier Part Number 1: SW1020DKR-ND; LCSC Part Number: C231329; Item Type: Switch
U4 = ESP32-S3FH4R2: 21dBm ESP32-S3R8 2.4GHz SMD WiFi Modules ROHS; Manufacturer: Espressif Systems; Item Type: IC; Supplier: Mouser; Supplier Part Number: 356-ESP32-S3FH4R2; Manufacturer Part Number: ESP32-S3FH4R2; RoHS: No; Stock: 2650; Pricing: 1=2.32, 10=2.32, 50=2.32, 100=2.32, 1000=2.32, 10000=2.32 (USD); LCSC Part Number: C3013940; ComponentLink1Description: LCSC; ComponentLink1URL: https://www.lcsc.com/product-detail/WiFi-Modules_Espressif-Systems-ESP32-S3FH4R2_C3013940.html
U5 = PS2705-1-F3-A: Optocoupler, Transistor, 3.75Kv, Sop-4 Rohs Compliant: Yes; Manufacturer: Renesas; Number of Channels: 1; Max Power Dissipation: 150mW; Max Collector Current: 80mA; Collector Emitter Voltage (VCEO): 40V; Collector Emitter Saturation Voltage: 300mV; Forward Voltage: 1.4V; Max Input Current: 50mA; Rise Time: 3us; Current Transfer Ratio: 300%; Input Type: AC; Supplier 1: Digi-Key; Manufacturer Part Number: PS2705-1-F3-A; RoHS: Yes; Category: Optocouplers; Stock 1: 58368; Pricing 1: 1=0.99000, 10=0.64600, 100=0.42290, 1000=0.35070 (USD); Mount: Surface Mount; Case/Package: SOP; Number of Pins: 4; Min Operating Temperature: -55°C; Max Operating Temperature: 100°C; Isolation Voltage: 3.75kV; Packaging: Tape and Reel; Number of Circuits: 1; Output Voltage: 40V; Number of Elements: 1; Forward Current: 50mA; Power Dissipation: 150mW; Radiation Hardening: No; Lead Free: Lead Free; RoHS Compliant: Yes; ComponentLink1URL: https://datasheet.ciiva.com/15119/getdatasheetpartid-627104-15119353.pdf?src-supplier=Verical; ComponentLink1Description: https://datasheet.ciiva.com/15119/getdatasheetpartid-627104-15119353.pdf?src-supplier=Verical; Supplier Part Number 1: 559-1030-1-ND; LCSC Part Number: C367377; Item Type: Optocoupler
X1 = X322540MPB4SI: 40MHz SMD Crystal Resonator 15pF SMD3225-4P Crystals ROHS; Manufacturer: Yangxing Tech; Manufacturer Part Number: X322540MPB4SI; Value: 40MHZ; LCSC Part Number: C9010; ComponentLink1Description: LCSC; ComponentLink1URL: https://www.lcsc.com/product-detail/Crystals_Yangxing-Tech-X322540MPB4SI_C9010.html; Item Type: Crystal

## Sheet Top-Sheet.SchDoc
size A4; SheetNumber: 1; SheetTotal: 3
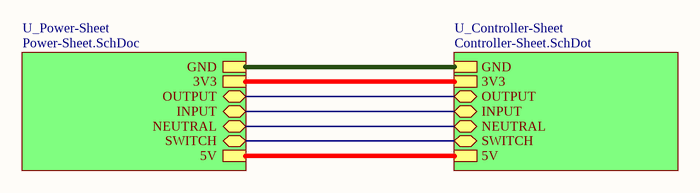
[diagram p1: Top-Sheet.SchDoc]

### Sub-sheets
U_Controller-Sheet = Controller-Sheet.SchDot (file not in this document): GND, 3V3, OUTPUT (bidir), INPUT (bidir), NEUTRAL (bidir), SWITCH (bidir), 5V
U_Power-Sheet = Power-Sheet.SchDoc: 3V3, GND, 5V, OUTPUT (bidir), SWITCH (bidir), INPUT (bidir), NEUTRAL (bidir)

### Nets
3V3: sheet U_Power-Sheet/3V3, sheet U_Controller-Sheet/3V3
5V: sheet U_Power-Sheet/5V, sheet U_Controller-Sheet/5V
GND: sheet U_Power-Sheet/GND, sheet U_Controller-Sheet/GND
I: sheet U_Power-Sheet/INPUT, sheet U_Controller-Sheet/INPUT
NEUTRAL: sheet U_Power-Sheet/NEUTRAL, sheet U_Controller-Sheet/NEUTRAL
O: sheet U_Power-Sheet/OUTPUT, sheet U_Controller-Sheet/OUTPUT
SWITCH: sheet U_Power-Sheet/SWITCH, sheet U_Controller-Sheet/SWITCH

### Notes on the sheet
- File:
- Title:
- Date:
- Page
- Num:
- Total:
- Drawn By: Huzaifa Ali